# Altium schematic sheet V_Divider_Solarb.SchDoc
size A4; SheetNumber: 15; SheetTotal: 17
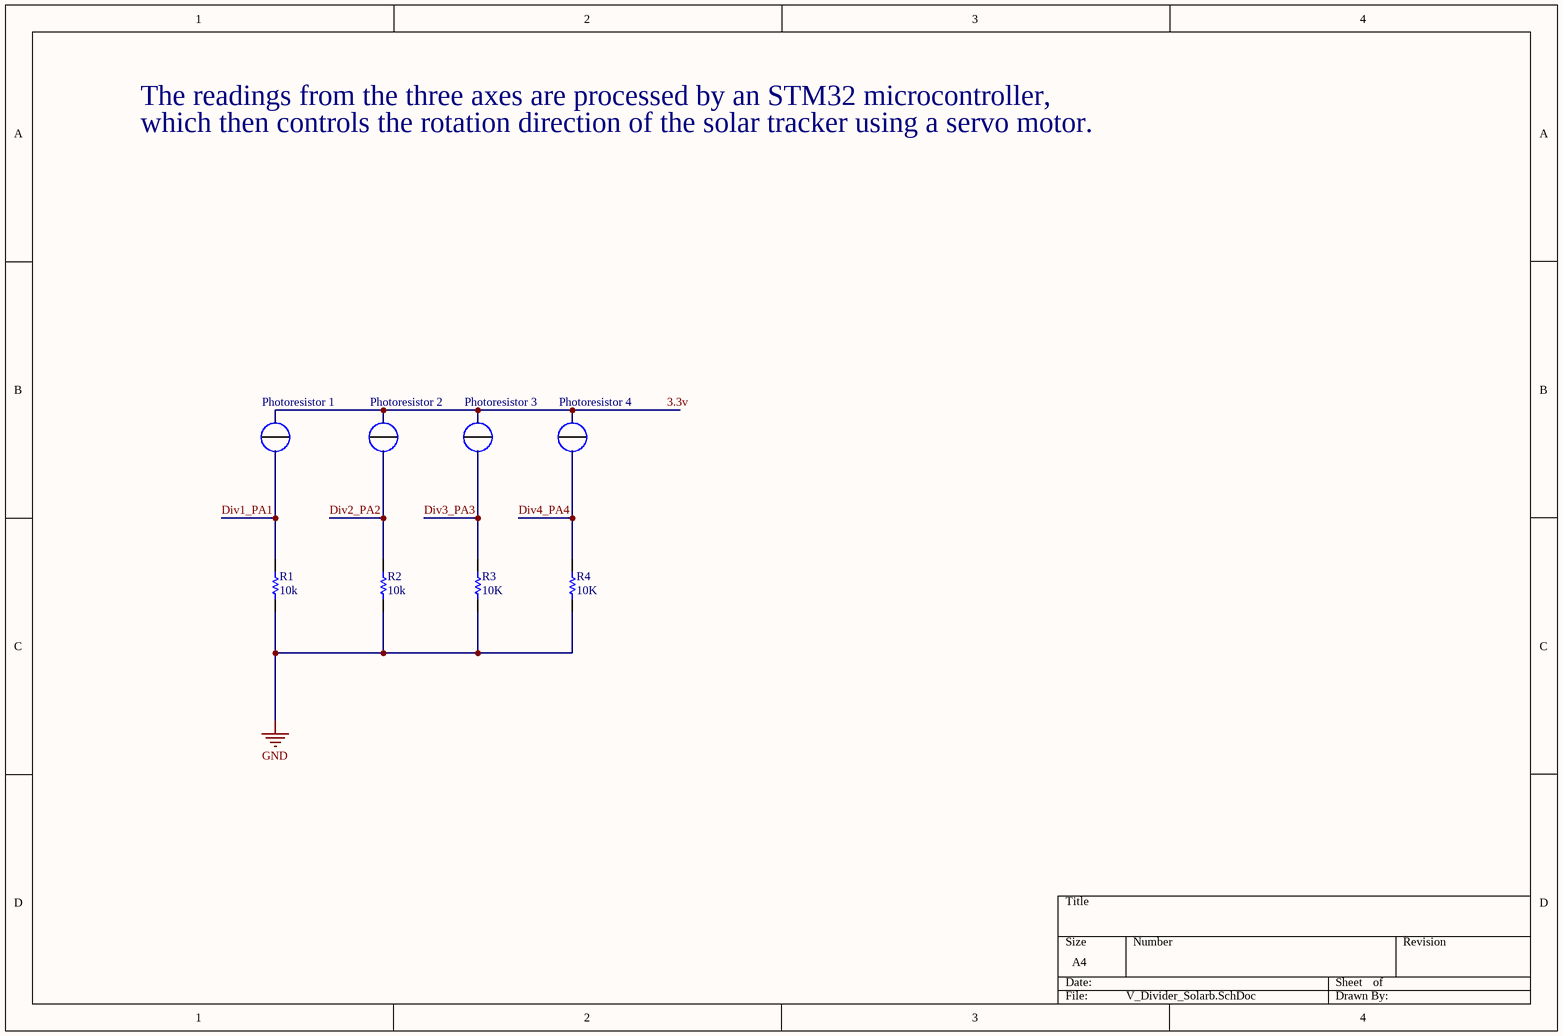
[diagram p0: V_Divider_Solarb.SchDoc]

## Parts
R1  10k  [RESC0603X26X15LL03T05]
R2  10k  [RESC0603X26X15LL03T05]
R3  10K  [RESC0603X26X15LL03T05]
R4  10K  [RESC0603X26X15LL03T05]

## Nets
GND: R1.1 R2.1 R3.1 R4.1
Div1_PA1: R1.2
Div2_PA2: R2.2
Div3_PA3: R3.2
Div4_PA4: R4.2

## Notes on the sheet
- The readings from the three axes are processed by an STM32 microcontroller,
- which then controls the rotation direction of the solar tracker using a servo motor.
- Photoresistor 1
- Photoresistor 2
- Photoresistor 3
- Photoresistor 4

## Library data of the parts
R1-R4 = CMP-2004-03568-1: Manufacturer: TE Connectivity / AMP; Part Number: CRG0201F10K